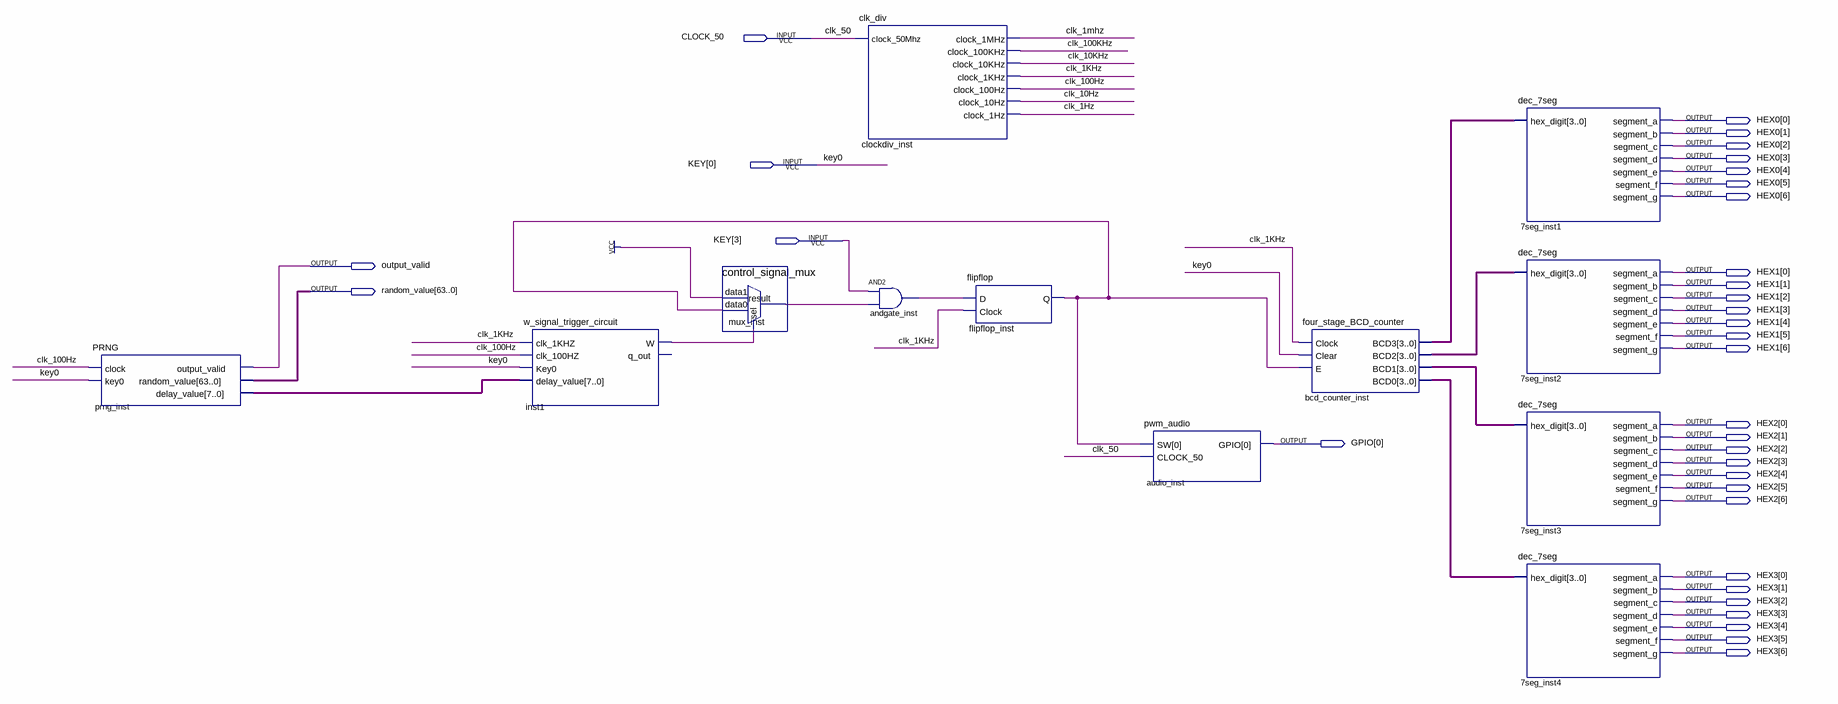
[diagram p0: schematic sheet]
// Quartus schematic reaction_timer_circuit.bdf as structural Verilog: 12 symbols, 34 pins
module reaction_timer_circuit (
  input  CLOCK_50,
  input  [3:0] KEY,
  output [6:0] HEX0,
  output output_valid,
  output [6:0] HEX1,
  output [63:0] random_value,
  output [6:0] HEX2,
  output [0:0] GPIO,
  output [6:0] HEX3
);

  wire andgate_inst_out, clk_1Hz, clk_1KHz, clk_1mhz, clk_10Hz, clk_10KHz, clk_100Hz, clk_100KHz,
       flipflop_inst_q, inst1_w, mux_inst_result;
  wire [3:0] bcd_counter_inst_bcd0, bcd_counter_inst_bcd1, bcd_counter_inst_bcd2, bcd_counter_inst_bcd3;
  wire [7:0] prng_inst_delay_value;

  PRNG prng_inst (
    .clock(clk_100Hz), .key0(KEY[0]), .output_valid(output_valid), .random_value(random_value),
    .delay_value(prng_inst_delay_value));
  w_signal_trigger_circuit inst1 (
    .clk_1KHZ(clk_1KHz), .clk_100HZ(clk_100Hz), .Key0(KEY[0]), .delay_value(prng_inst_delay_value),
    .W(inst1_w));  // open: q_out
  control_signal_mux mux_inst (.data1(1'b1), .data0(flipflop_inst_q), .sel(inst1_w), .result(mux_inst_result));
  clk_div clockdiv_inst (
    .clock_50Mhz(CLOCK_50), .clock_1MHz(clk_1mhz), .clock_100KHz(clk_100KHz), .clock_10KHz(clk_10KHz),
    .clock_1KHz(clk_1KHz), .clock_100Hz(clk_100Hz), .clock_10Hz(clk_10Hz), .clock_1Hz(clk_1Hz));
  and andgate_inst (andgate_inst_out, KEY[3], mux_inst_result);
  flipflop flipflop_inst (.D(andgate_inst_out), .Clock(clk_1KHz), .Q(flipflop_inst_q));
  pwm_audio audio_inst (.SW(flipflop_inst_q), .CLOCK_50(CLOCK_50), .GPIO(GPIO[0]));
  four_stage_BCD_counter bcd_counter_inst (
    .Clock(clk_1KHz), .Clear(KEY[0]), .E(flipflop_inst_q), .BCD3(bcd_counter_inst_bcd3),
    .BCD2(bcd_counter_inst_bcd2), .BCD1(bcd_counter_inst_bcd1), .BCD0(bcd_counter_inst_bcd0));
  dec_7seg u_7seg_inst1 (
    .hex_digit(bcd_counter_inst_bcd3), .segment_a(HEX0[0]), .segment_b(HEX0[1]), .segment_c(HEX0[2]),
    .segment_d(HEX0[3]), .segment_e(HEX0[4]), .segment_f(HEX0[5]), .segment_g(HEX0[6]));
  dec_7seg u_7seg_inst2 (
    .hex_digit(bcd_counter_inst_bcd2), .segment_a(HEX1[0]), .segment_b(HEX1[1]), .segment_c(HEX1[2]),
    .segment_d(HEX1[3]), .segment_e(HEX1[4]), .segment_f(HEX1[5]), .segment_g(HEX1[6]));
  dec_7seg u_7seg_inst3 (
    .hex_digit(bcd_counter_inst_bcd1), .segment_a(HEX2[0]), .segment_b(HEX2[1]), .segment_c(HEX2[2]),
    .segment_d(HEX2[3]), .segment_e(HEX2[4]), .segment_f(HEX2[5]), .segment_g(HEX2[6]));
  dec_7seg u_7seg_inst4 (
    .hex_digit(bcd_counter_inst_bcd0), .segment_a(HEX3[0]), .segment_b(HEX3[1]), .segment_c(HEX3[2]),
    .segment_d(HEX3[3]), .segment_e(HEX3[4]), .segment_f(HEX3[5]), .segment_g(HEX3[6]));

  // Other names for the same wires on the sheet: clk_50 = CLOCK_50
endmodule
